# Altium project TestCoupon.PrjPcb
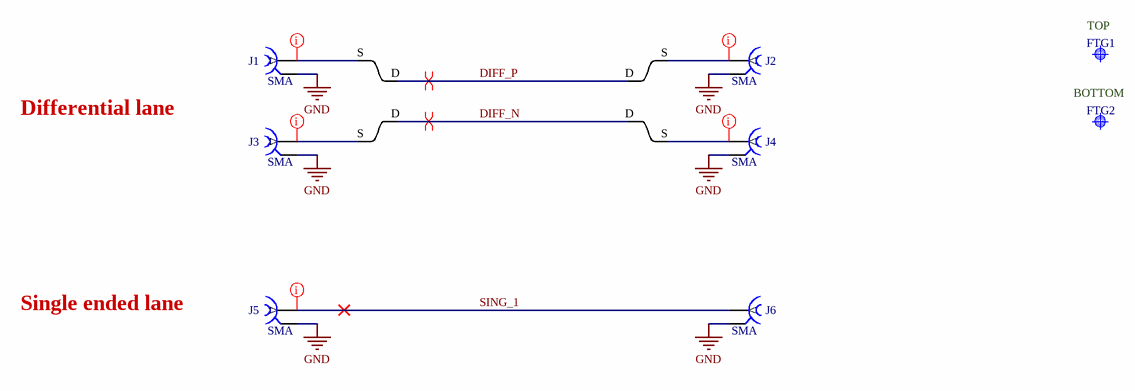
[diagram p0: TestCoupon.SchDoc]
Project: CDR Test Coupon
1 sheet, 12 parts. Net scope: global (net labels, ports and power ports of the same name join across sheets).
Board file: TestCoupon.PcbDoc

## Sheet TestCoupon.SchDoc: CDR
size 297 x 209 mm; CheckedBy: E.Orzes F.Martina; CompanyName: CERN; DrawnBy: E. Orzes; Organization: CERN; Address1: European Organization for Nuclear Research; Address2: CH-1211 Genève 23 - Switzerland; Revision: 1.0; SheetNumber: 1; SheetTotal: 1; Projet: CDR Test Coupon; DivGrp: EP-ESE; Designer: E.Orzes

### Parts
FTG1  Use only in PCB  [FIDUCIAL_TOP_C100-200]  (value not drawn)
FTG2  Use only in PCB  [FIDUCIAL_TOP_C100-200]  (value not drawn)
J1  SMA  [SAMTEC_SMA-J-P-H-ST-MT1]
J2  SMA  [SAMTEC_SMA-J-P-H-ST-MT1]
J3  SMA  [SAMTEC_SMA-J-P-H-ST-MT1]
J4  SMA  [SAMTEC_SMA-J-P-H-ST-MT1]
J5  SMA  [SAMTEC_SMA-J-P-H-ST-MT1]
J6  SMA  [SAMTEC_SMA-J-P-H-ST-MT1]
TA1  Differential to Single Transition  [lane_width_transition]  (value not drawn)  (net tie, no BOM)
TA2  Differential to Single Transition  [lane_width_transition]  (value not drawn)  (net tie, no BOM)
TA3  Differential to Single Transition  [lane_width_transition]  (value not drawn)  (net tie, no BOM)
TA4  Differential to Single Transition  [lane_width_transition]  (value not drawn)  (net tie, no BOM)

### Nets
GND: J1.2 J2.2 J3.2 J4.2 J5.2 J6.2
DIFF_N: TA3.D TA4.D
DIFF_P: TA1.D TA2.D
SING_1: J5.1 J6.1
NetJ1_1: J1.1 TA1.S
NetJ2_1: J2.1 TA2.S
NetJ3_1: J3.1 TA3.S
NetJ4_1: J4.1 TA4.S

### Layout directives
differential pair: DIFF_N, DIFF_P
net class 50ohm: NetJ1_1, NetJ2_1, NetJ3_1, NetJ4_1, SING_1

### Notes on the sheet
- (near FTG1) TOP
- Differential lane
- BOTTOM
- Single ended lane
- Project/Equipment
- Document
- Designer
- Drawn by
- Check.by
- File
- Last Mod.
- Print Date
- Sheet
- Size
- A4
- of
- Rev

### Library data of the parts
FTG1 FTG2 = FIDUCIAL_TARGET_C100-200: Fiducial Target; Part Description: Round Fiducial Target, Top Layer, 1.0mm, Top Solder 2.0mm, Keepout =2.0mm; Mounted: No; Part Number: FIDUCIAL_TARGET_C100-200; Component Kind: Standard (No BOM); Component Type: Standard (No BOM); Pin Count: 1; Family: Fiducial; Socket: No; SMD: Yes; Sense: No; Status: None; ComponentHeight: 0mm; HelpURL: Undefined; Author: CERN DEM JLC; CreateDate: 09/02/2010; LatestRevisionDate: 04/04/2012; PackageDescription: Round Fiducial Target, Top Layer, 1.0mm, Top Solder 2.0mm, Keepout =2.0mm
J1-J6 = SAMTEC_SMA-J-P-H-ST-MT1: Part Description: 50 Ohms SMA Straight Mixed Technology PCB Jack; Manufacturer: SAMTEC; PressFit: No; Sense Comment: assembly limitations; Part Number: SAMTEC_SMA-J-P-H-ST-MT1; Component Kind: Standard; Component Type: Standard; Pin Count: 5; Family: SMA; Mounted: Yes; Socket: No; SMD: Yes; Sense: Yes; Status: Not Recommended; Manufacturer Part Number: SMA-J-P-H-ST-MT1; ComponentHeight: 7.95mm; HelpURL: \\cern.ch\dfs\Applications\Altium\Datasheets\SAMTEC_SMA-J-P-H-ST-MT1.pdf; Author: CERN DEM HF; CreateDate: 5/24/2023; LatestRevisionDate: 5/24/2023
TA1-TA4 = lane_width_transition